# Altium schematic sheet DSP大板子.SchDoc (part 4 of 7)
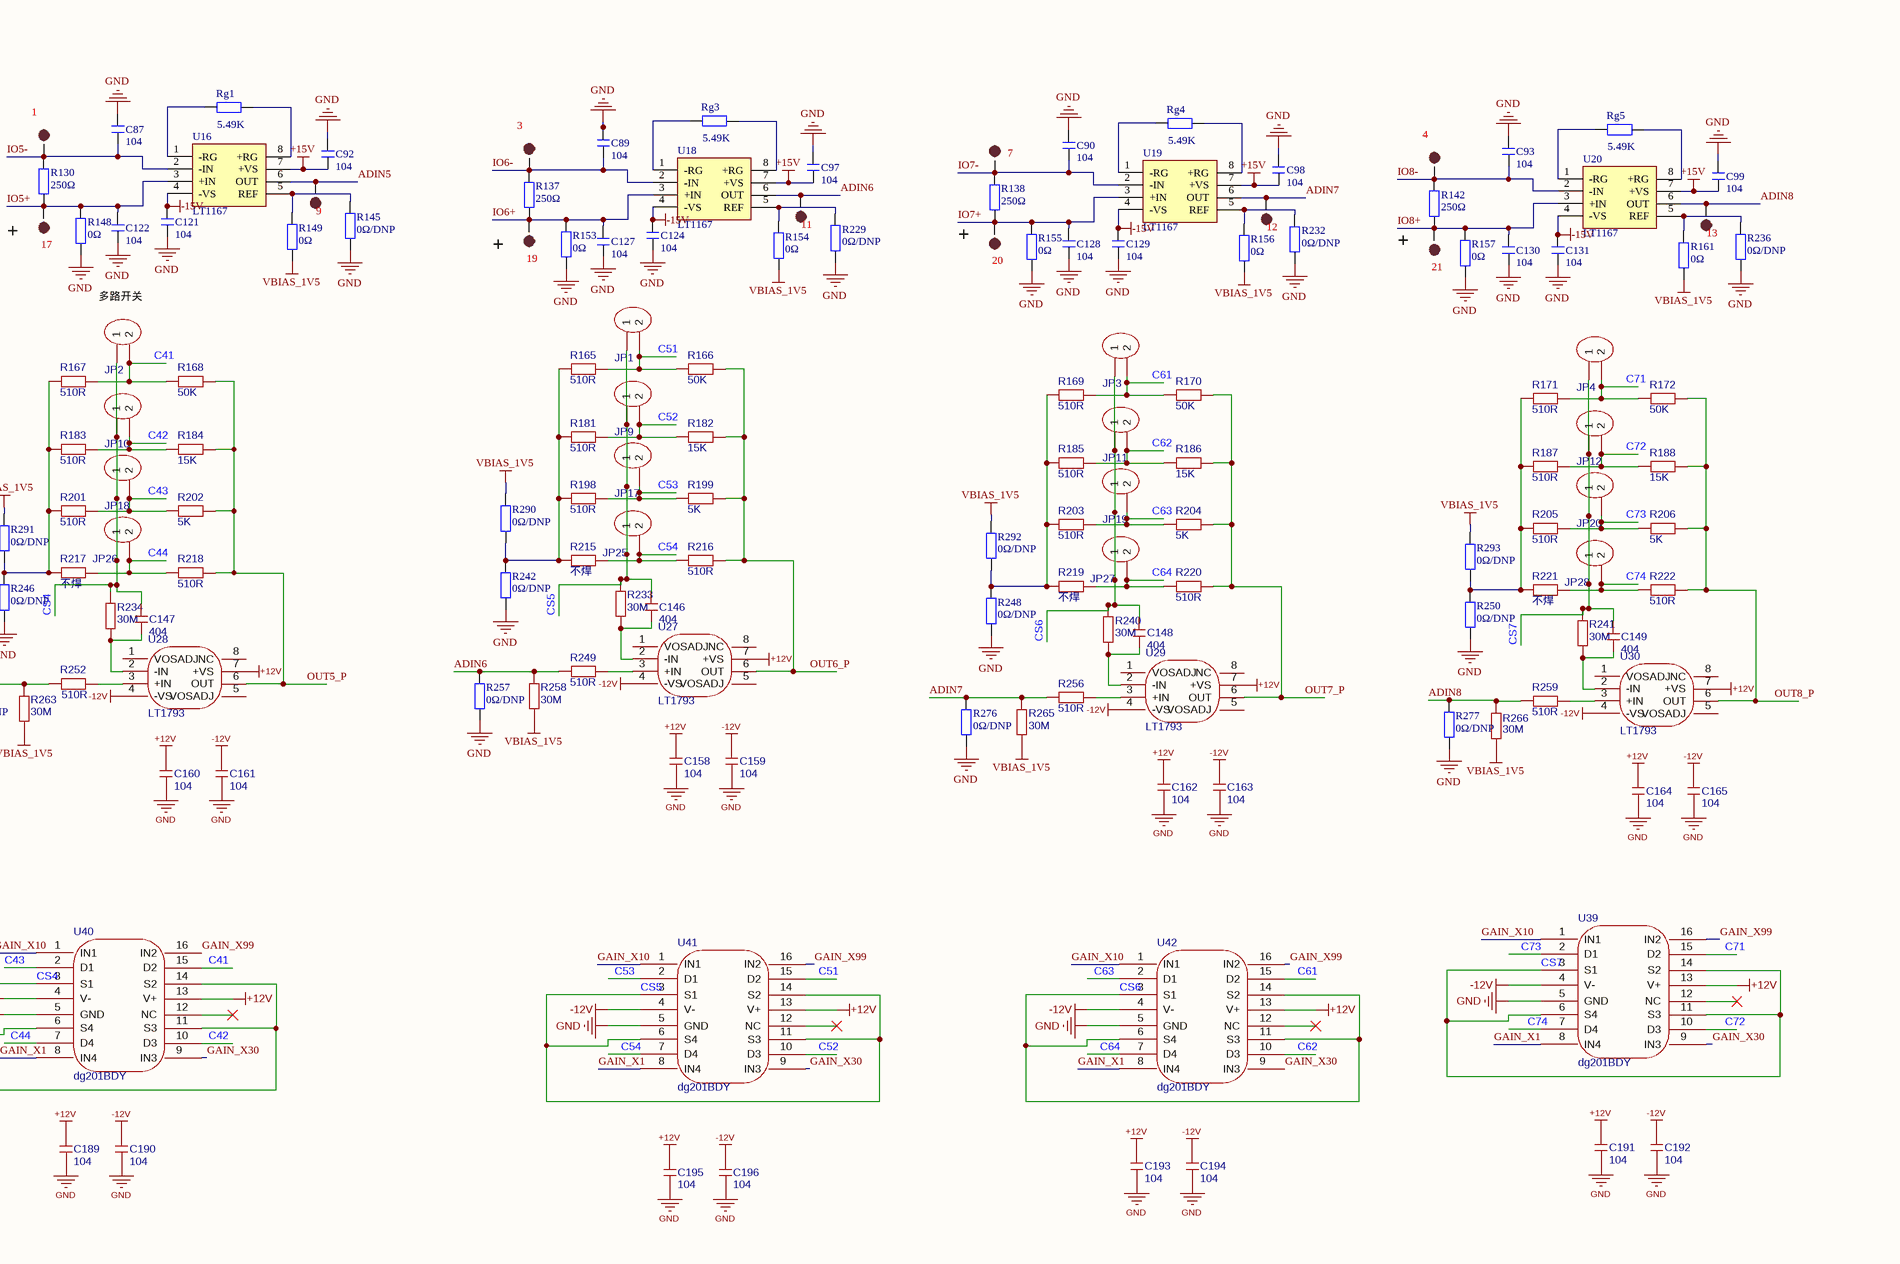
[diagram p7: DSP大板子.SchDoc, bottom right]

## Library data of the parts (continued)